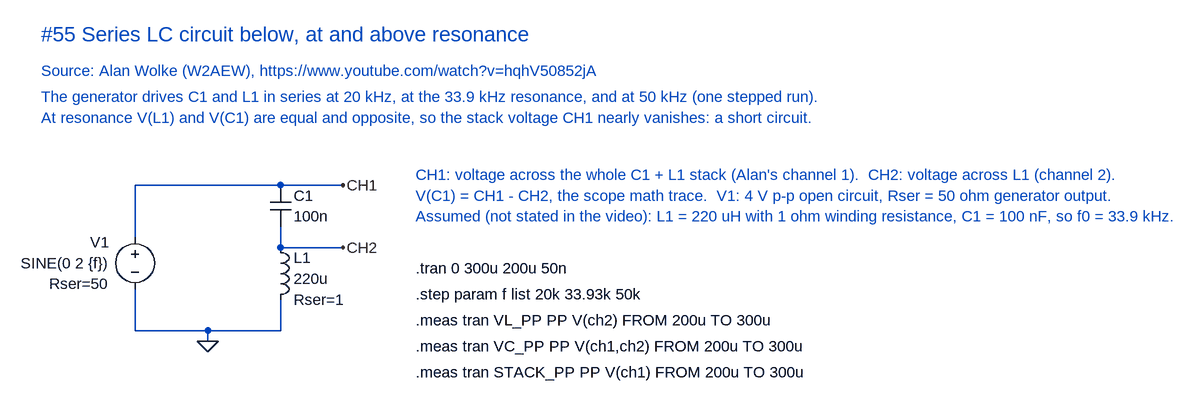
[diagram p0: schematic Series LC below at and above resonance.asc]
Series LC below at and above resonance.asc, the LTspice schematic file:
Version 4.1
SHEET 1 1400 700
WIRE 48 32 272 32
WIRE 272 32 368 32
WIRE 48 32 48 112
WIRE 272 96 272 128
WIRE 272 128 368 128
WIRE 272 208 272 256
WIRE 48 192 48 256
WIRE 48 256 160 256
WIRE 160 256 272 256
WIRE 160 256 160 272
FLAG 160 272 0
FLAG 368 32 CH1
FLAG 368 128 CH2
SYMBOL voltage 48 96 R0
WINDOW 0 -40 24 Right 2
WINDOW 3 -40 56 Right 2
WINDOW 123 0 0 Left 0
WINDOW 39 -40 88 Right 2
SYMATTR InstName V1
SYMATTR Value SINE(0 2 {f})
SYMATTR SpiceLine Rser=50
SYMBOL cap 256 32 R0
WINDOW 0 36 16 Left 2
WINDOW 3 36 48 Left 2
SYMATTR InstName C1
SYMATTR Value 100n
SYMBOL ind 256 112 R0
WINDOW 0 36 32 Left 2
WINDOW 3 36 64 Left 2
WINDOW 39 36 96 Left 2
SYMATTR InstName L1
SYMATTR Value 220u
SYMATTR SpiceLine Rser=1
TEXT -96 -200 Left 3 ;#55 Series LC circuit below, at and above resonance
TEXT -96 -144 Left 2 ;Source: Alan Wolke (W2AEW), https://www.youtube.com/watch?v=hqhV50852jA
TEXT -96 -104 Left 2 ;The generator drives C1 and L1 in series at 20 kHz, at the 33.9 kHz resonance, and at 50 kHz (one stepped run).
TEXT -96 -72 Left 2 ;At resonance V(L1) and V(C1) are equal and opposite, so the stack voltage CH1 nearly vanishes: a short circuit.
TEXT 480 16 Left 2 ;CH1: voltage across the whole C1 + L1 stack (Alan's channel 1).  CH2: voltage across L1 (channel 2).
TEXT 480 48 Left 2 ;V(C1) = CH1 - CH2, the scope math trace.  V1: 4 V p-p open circuit, Rser = 50 ohm generator output.
TEXT 480 80 Left 2 ;Assumed (not stated in the video): L1 = 220 uH with 1 ohm winding resistance, C1 = 100 nF, so f0 = 33.9 kHz.
TEXT 480 160 Left 2 !.tran 0 300u 200u 50n
TEXT 480 200 Left 2 !.step param f list 20k 33.93k 50k
TEXT 480 240 Left 2 !.meas tran VL_PP PP V(ch2) FROM 200u TO 300u
TEXT 480 280 Left 2 !.meas tran VC_PP PP V(ch1,ch2) FROM 200u TO 300u
TEXT 480 320 Left 2 !.meas tran STACK_PP PP V(ch1) FROM 200u TO 300u

The netlist it stands for:
* Series LC below at and above resonance.asc
V1 CH1 0 SINE(0 2 {f}) Rser=50
C1 CH1 CH2 100n
L1 CH2 0 220u Rser=1
* #55 Series LC circuit below, at and above resonance
* Source: Alan Wolke (W2AEW), https://www.youtube.com/watch?v=hqhV50852jA
* The generator drives C1 and L1 in series at 20 kHz, at the 33.9 kHz resonance, and at 50 kHz (one stepped run).
* At resonance V(L1) and V(C1) are equal and opposite, so the stack voltage CH1 nearly vanishes: a short circuit.
* CH1: voltage across the whole C1 + L1 stack (Alan's channel 1).  CH2: voltage across L1 (channel 2).
* V(C1) = CH1 - CH2, the scope math trace.  V1: 4 V p-p open circuit, Rser = 50 ohm generator output.
* Assumed (not stated in the video): L1 = 220 uH with 1 ohm winding resistance, C1 = 100 nF, so f0 = 33.9 kHz.
.tran 0 300u 200u 50n
.step param f list 20k 33.93k 50k
.meas tran VL_PP PP V(ch2) FROM 200u TO 300u
.meas tran VC_PP PP V(ch1,ch2) FROM 200u TO 300u
.meas tran STACK_PP PP V(ch1) FROM 200u TO 300u
.backanno
.end